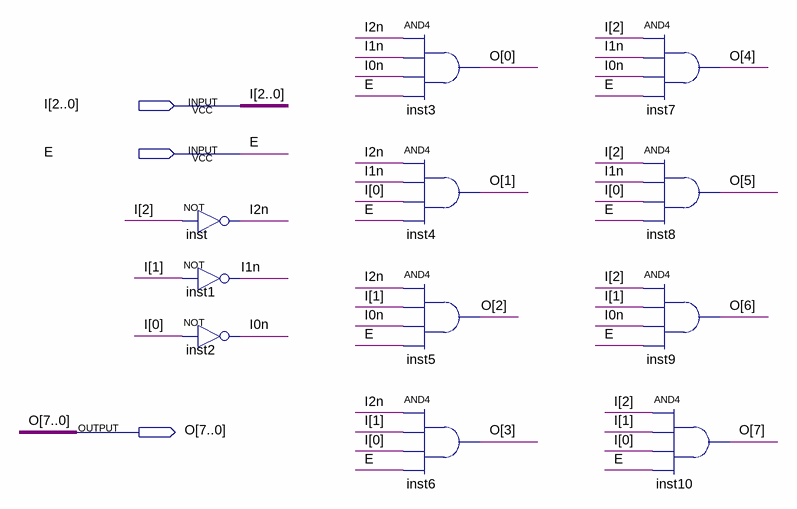
[diagram p0: schematic sheet]
// Quartus schematic decoder3_8.bdf as structural Verilog: 11 symbols, 3 pins
module decoder3_8 (
  input  [2:0] I,
  input  E,
  output [7:0] O
);

  wire I0n, I1n, I2n;

  not inst (I2n, I[2]);
  not inst1 (I1n, I[1]);
  not inst2 (I0n, I[0]);
  and inst3 (O[0], I2n, I1n, I0n, E);
  and inst4 (O[1], I2n, I1n, I[0], E);
  and inst5 (O[2], I2n, I[1], I0n, E);
  and inst6 (O[3], I2n, I[1], I[0], E);
  and inst7 (O[4], I[2], I1n, I0n, E);
  and inst8 (O[5], I[2], I1n, I[0], E);
  and inst9 (O[6], I[2], I[1], I0n, E);
  and inst10 (O[7], I[2], I[1], I[0], E);
endmodule
